# Altium schematic sheet Controller_Section.SchDoc
size 420 x 297 mm; DocumentNumber: 7; SheetNumber: 7; SheetTotal: 17
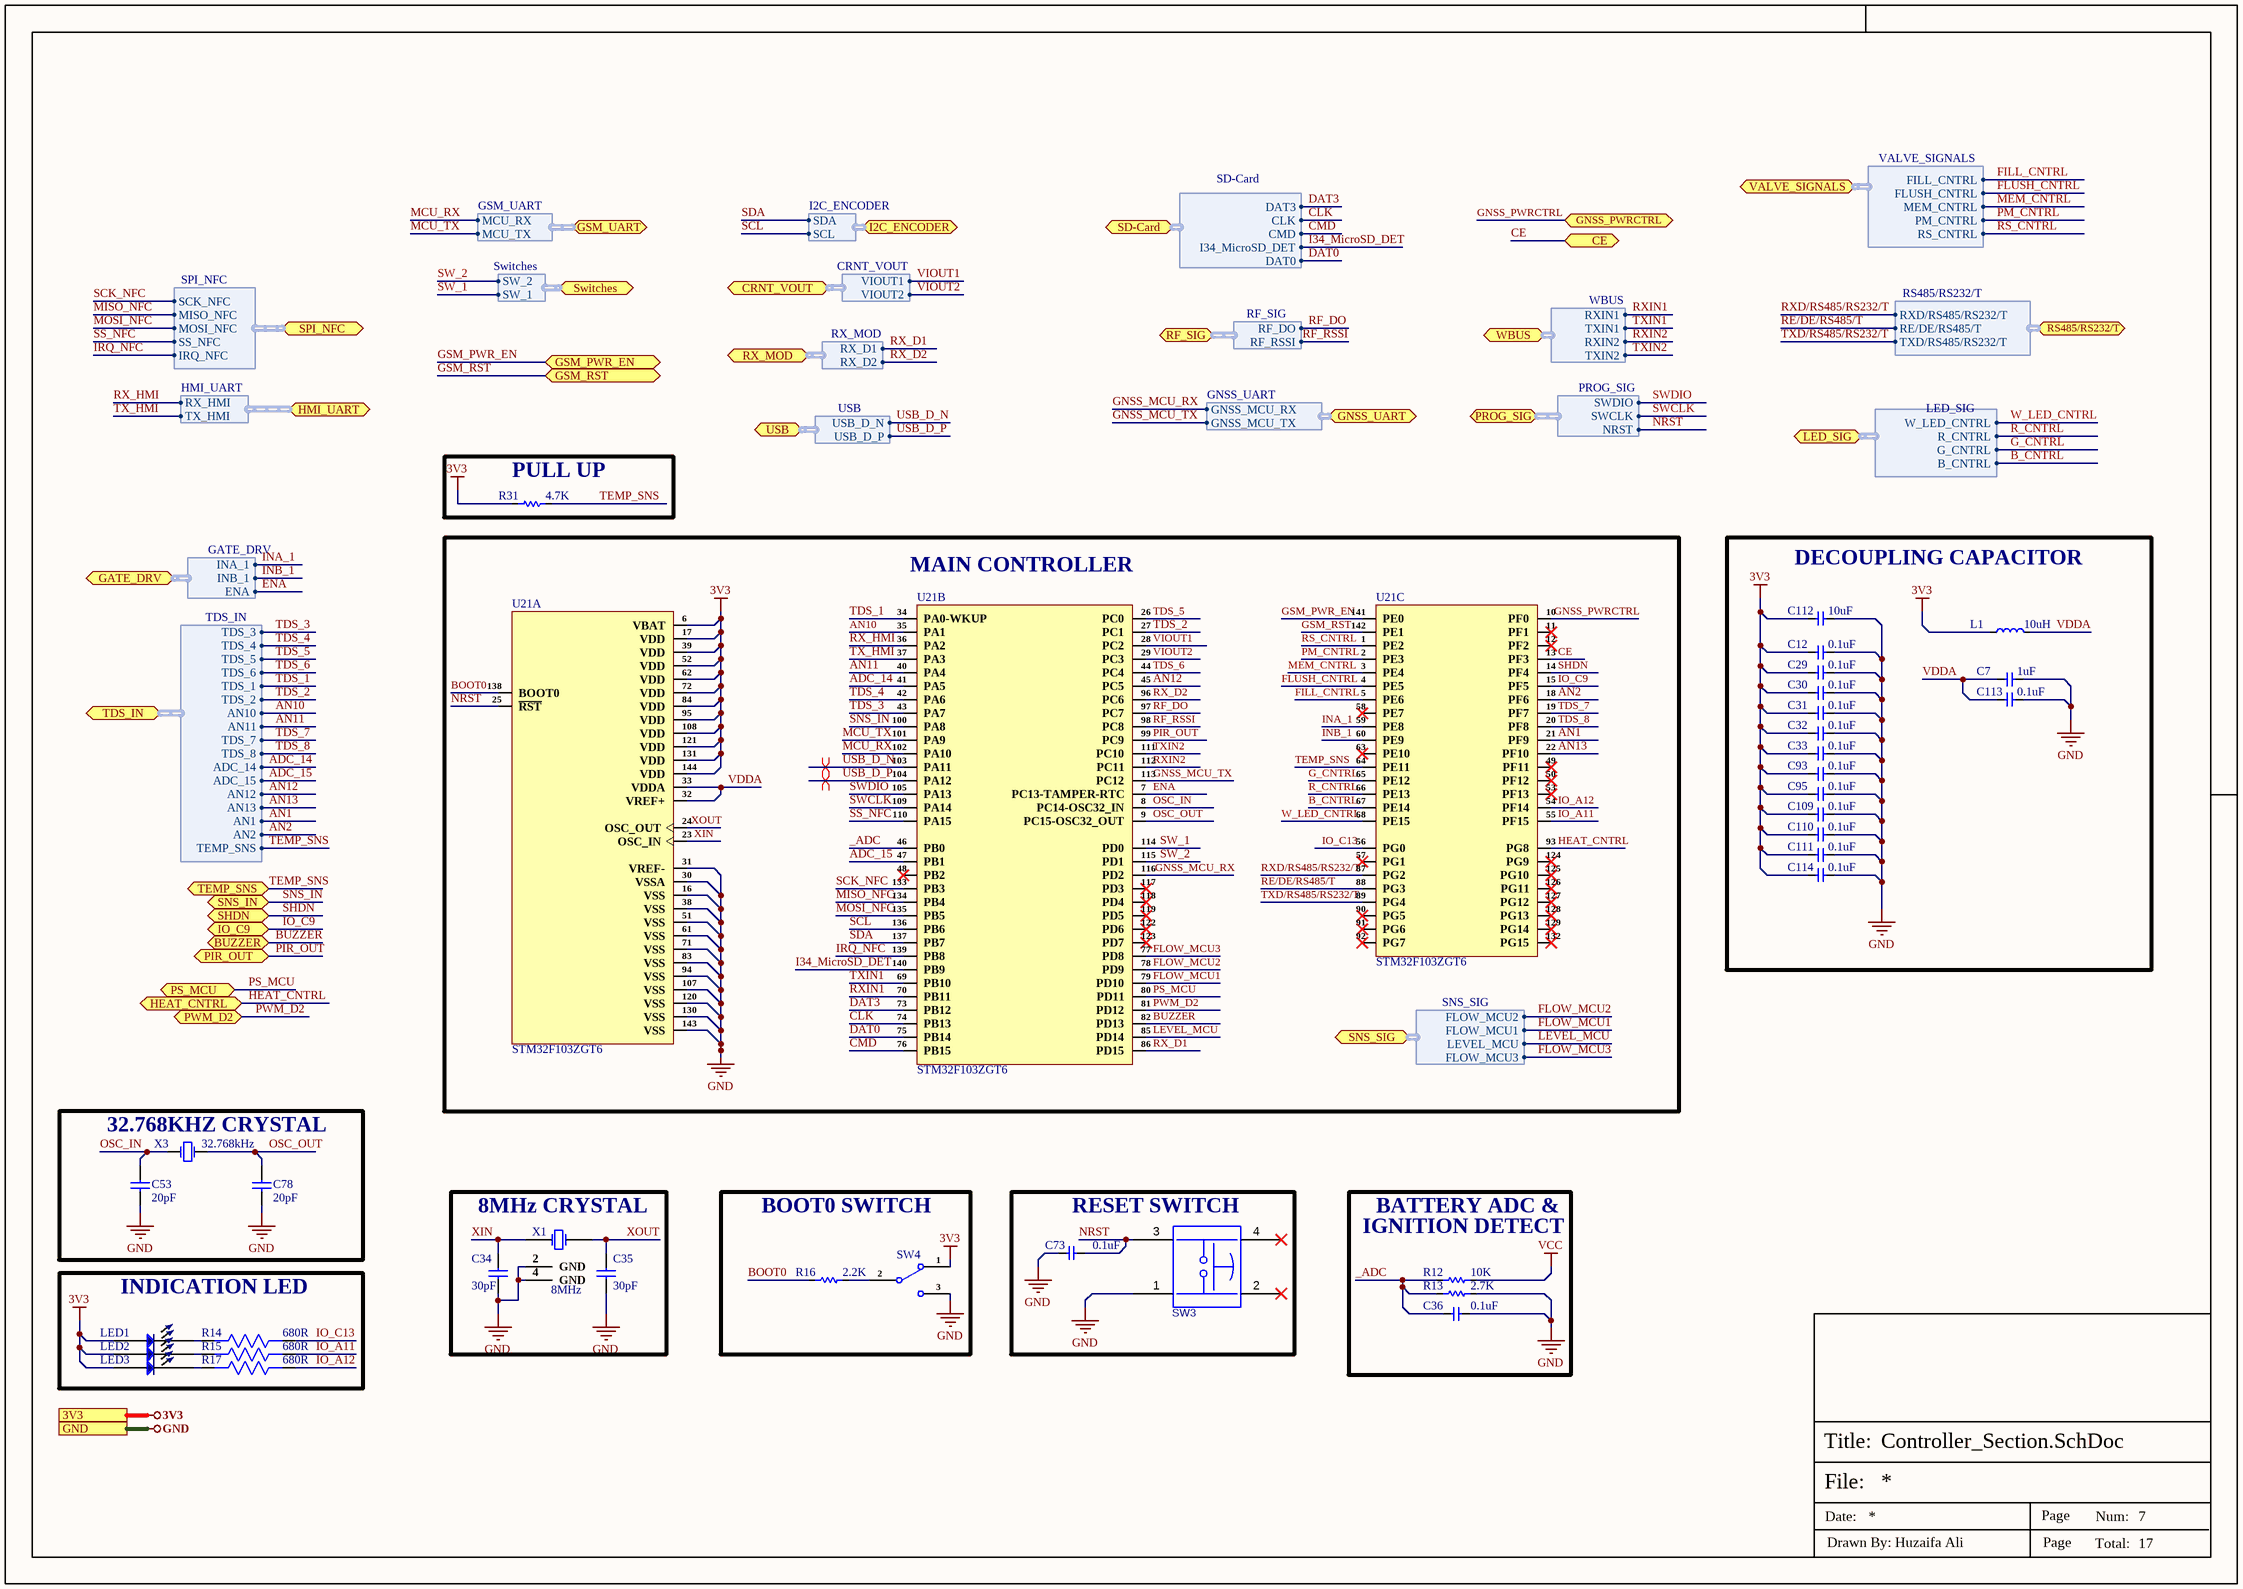
[diagram p0: Controller_Section.SchDoc]

## Parts
C7  1uF  [Cap-0402]
C12  0.1uF  [Cap-0402]
C29  0.1uF  [Cap-0402]
C30  0.1uF  [Cap-0402]
C31  0.1uF  [Cap-0402]
C32  0.1uF  [Cap-0402]
C33  0.1uF  [Cap-0402]
C34  30pF  [Cap0603]
C35  30pF  [Cap0603]
C36  0.1uF  [Cap-0402]
C53  20pF  [Cap0603]
C73  0.1uF  [Cap-0402]
C78  20pF  [Cap0603]
C93  0.1uF  [Cap-0402]
C95  0.1uF  [Cap-0402]
C109  0.1uF  [Cap-0402]
C110  0.1uF  [Cap-0402]
C111  0.1uF  [Cap-0402]
C112  10uF  [Cap-0402]
C113  0.1uF  [Cap-0402]
C114  0.1uF  [Cap-0402]
L1  10uH  [Ind-0805]
LED1  XZMDK68W-2  [LED 0402]  (value not drawn)
LED2  XZMDK68W-2  [LED 0402]  (value not drawn)
LED3  XZMDK68W-2  [LED 0402]  (value not drawn)
R12  10K  [Res-0402]
R13  2.7K  [Res-0402]
R14  680R  [RES-0603]
R15  680R  [RES-0603]
R16  2.2K  [Res-0402]
R17  680R  [RES-0603]
R31  4.7K  [Res-0402]
SW3  (no value)  [TL3300CF160Q]
SW4  (no value)  [SS-12D02-G040]
U21  STM32F103ZGT6  [LQFP-144(20x20)]  (parts A,B,C of 3)
X1  8MHz  [XC32M4-8.000-F18LJDT]
X3  32.768kHz  [X321532768KGD2SI]

## Blocks framed on the sheet
PULL UP: R31
MAIN CONTROLLER: U21
DECOUPLING CAPACITOR: C7 C12 C29-C33 C93 C95 C109-C114 L1
32.768KHZ CRYSTAL: C53 C78 X3
8MHz CRYSTAL: C34 C35 X1
BOOT0 SWITCH: R16 SW4
RESET SWITCH: C73 SW3
INDICATION LED: LED1-LED3 R14 R15 R17

## Ports
3V3, BUZZER (bidir), CE (bidir), CRNT_VOUT (bidir, harness CRNT_VOUT), GATE_DRV (bidir, harness GATE_DRV), GND, GNSS_PWRCTRL (bidir), GNSS_UART (bidir, harness GNSS_UART), GSM_PWR_EN (bidir), GSM_RST (bidir), GSM_UART (bidir, harness GSM_UART), HEAT_CNTRL (bidir), HMI_UART (bidir, harness HMI_UART), I2C_ENCODER (bidir, harness I2C_ENCODER), IO_C9 (bidir), LED_SIG (bidir, harness LED_SIG), PIR_OUT (bidir), PROG_SIG (bidir, harness PROG_SIG), PS_MCU (bidir), PWM_D2 (bidir), RF_SIG (bidir, harness RF_SIG), RS485/RS232/T (bidir, harness RS485/RS232/T), RX_MOD (bidir, harness RX_MOD), SD-Card (bidir, harness SD-Card), SHDN (bidir), SNS_IN (bidir), SNS_SIG (bidir, harness SNS_SIG), SPI_NFC (bidir, harness SPI_NFC), Switches (bidir, harness Switches), TDS_IN (bidir, harness TDS_IN), TEMP_SNS (bidir), USB (bidir, harness USB), VALVE_SIGNALS (bidir, harness VALVE_SIGNALS), WBUS (bidir, harness WBUS)

## Harnesses
PROG_SIG: SWDIO, SWCLK, NRST
GATE_DRV: INA_1, INB_1, ENA
LED_SIG: R_CNTRL, G_CNTRL, B_CNTRL, W_LED_CNTRL
VALVE_SIGNALS: FILL_CNTRL, FLUSH_CNTRL, MEM_CNTRL, PM_CNTRL, RS_CNTRL
SNS_SIG: FLOW_MCU1, LEVEL_MCU, FLOW_MCU2, FLOW_MCU3
WBUS: RXIN1, TXIN1, RXIN2, TXIN2
RF_SIG: RF_DO, RF_RSSI
RX_MOD: RX_D1, RX_D2
CRNT_VOUT: VIOUT1, VIOUT2
TDS_IN: TDS_1, TDS_2, AN10, AN11, TDS_3, TDS_4, TDS_5, TDS_6, TDS_7, TDS_8, ADC_14, ADC_15, AN12, AN13, AN1, AN2, TEMP_SNS
USB: USB_D_N, USB_D_P
Switches: SW_1, SW_2
GSM_UART: MCU_RX, MCU_TX
GNSS_UART: GNSS_MCU_RX, GNSS_MCU_TX
SD-Card: DAT3, CLK, CMD, DAT0, I34_MicroSD_DET
HMI_UART: RX_HMI, TX_HMI
I2C_ENCODER: SDA, SCL
SPI_NFC: MISO_NFC, MOSI_NFC, SS_NFC, IRQ_NFC, SCK_NFC
RS485/RS232/T: RXD/RS485/RS232/T, RE/DE/RS485/T, TXD/RS485/RS232/T

## Nets
3V3: C12.1 C29.1 C30.1 C31.1 C32.1 C33.1 C93.1 C95.1 C109.1 C110.1 C111.1 C112.1 C114.1 L1.1 LED1.1 LED2.1 LED3.1 R31.1 SW4.1 U21.6(VBAT) U21.17(VDD) U21.39(VDD) U21.52(VDD) U21.62(VDD) U21.72(VDD) U21.84(VDD) U21.95(VDD) U21.108(VDD) U21.121(VDD) U21.131(VDD) U21.144(VDD) ; port 3V3
GND: C7.2 C12.2 C29.2 C30.2 C31.2 C32.2 C33.2 C34.1 C35.1 C36.2 C53.1 C73.1 C78.1 C93.2 C95.2 C109.2 C110.2 C111.2 C112.2 C113.2 C114.2 R13.2 SW3.1 SW4.3 U21.16(VSS) U21.30(VSSA) U21.31(VREF-) U21.38(VSS) U21.51(VSS) U21.61(VSS) U21.71(VSS) U21.83(VSS) U21.94(VSS) U21.107(VSS) U21.120(VSS) U21.130(VSS) U21.143(VSS) X1.2(GND) X1.4(GND) ; port GND
VCC: R12.2
_ADC: C36.1 R12.1 R13.1 U21.46(PB0)
ADC_14: U21.41(PA5) ; port TDS_IN.ADC_14
ADC_15: U21.47(PB1) ; port TDS_IN.ADC_15
AN1: U21.21(PF9) ; port TDS_IN.AN1
AN2: U21.18(PF6) ; port TDS_IN.AN2
AN10: U21.35(PA1) ; port TDS_IN.AN10
AN11: U21.40(PA4) ; port TDS_IN.AN11
AN12: U21.45(PC5) ; port TDS_IN.AN12
AN13: U21.22(PF10) ; port TDS_IN.AN13
B_CNTRL: U21.67(PE14) ; port LED_SIG.B_CNTRL
BOOT0: R16.1 U21.138(BOOT0)
BUZZER: U21.82(PD13) ; port BUZZER
CE: U21.13(PF3) ; port CE
CLK: U21.74(PB13) ; port SD-Card.CLK
CMD: U21.76(PB15) ; port SD-Card.CMD
DAT0: U21.75(PB14) ; port SD-Card.DAT0
DAT3: U21.73(PB12) ; port SD-Card.DAT3
ENA: U21.7(PC13-TAMPER-RTC) ; port GATE_DRV.ENA
FILL_CNTRL: U21.5(PE6) ; port VALVE_SIGNALS.FILL_CNTRL
FLOW_MCU1: U21.79(PD10) ; port SNS_SIG.FLOW_MCU1
FLOW_MCU2: U21.78(PD9) ; port SNS_SIG.FLOW_MCU2
FLOW_MCU3: U21.77(PD8) ; port SNS_SIG.FLOW_MCU3
FLUSH_CNTRL: U21.4(PE5) ; port VALVE_SIGNALS.FLUSH_CNTRL
G_CNTRL: U21.65(PE12) ; port LED_SIG.G_CNTRL
GNSS_MCU_RX: U21.116(PD2) ; port GNSS_UART.GNSS_MCU_RX
GNSS_MCU_TX: U21.113(PC12) ; port GNSS_UART.GNSS_MCU_TX
GNSS_PWRCTRL: U21.10(PF0) ; port GNSS_PWRCTRL
GSM_PWR_EN: U21.141(PE0) ; port GSM_PWR_EN
GSM_RST: U21.142(PE1) ; port GSM_RST
HEAT_CNTRL: U21.93(PG8) ; port HEAT_CNTRL
I34_MicroSD_DET: U21.140(PB9) ; port SD-Card.I34_MicroSD_DET
INA_1: U21.59(PE8) ; port GATE_DRV.INA_1
INB_1: U21.60(PE9) ; port GATE_DRV.INB_1
IO_A11: R15.1 U21.55(PF15)
IO_A12: R17.1 U21.54(PF14)
IO_C9: U21.15(PF5) ; port IO_C9
IO_C13: R14.1 U21.56(PG0)
IRQ_NFC: U21.139(PB8) ; port SPI_NFC.IRQ_NFC
LEVEL_MCU: U21.85(PD14) ; port SNS_SIG.LEVEL_MCU
MCU_RX: U21.102(PA10) ; port GSM_UART.MCU_RX
MCU_TX: U21.101(PA9) ; port GSM_UART.MCU_TX
MEM_CNTRL: U21.3(PE4) ; port VALVE_SIGNALS.MEM_CNTRL
MISO_NFC: U21.134(PB4) ; port SPI_NFC.MISO_NFC
MOSI_NFC: U21.135(PB5) ; port SPI_NFC.MOSI_NFC
NRST: C73.2 SW3.3 U21.25(~{RST}) ; port PROG_SIG.NRST
OSC_IN: C53.2 U21.8(PC14-OSC32_IN) X3.1(OSC1)
OSC_OUT: C78.2 U21.9(PC15-OSC32_OUT) X3.2(OSC2)
PIR_OUT: U21.99(PC9) ; port PIR_OUT
PM_CNTRL: U21.2(PE3) ; port VALVE_SIGNALS.PM_CNTRL
PS_MCU: U21.80(PD11) ; port PS_MCU
PWM_D2: U21.81(PD12) ; port PWM_D2
R_CNTRL: U21.66(PE13) ; port LED_SIG.R_CNTRL
RE/DE/RS485/T: U21.88(PG3) ; port RS485/RS232/T.RE/DE/RS485/T
RF_DO: U21.97(PC7) ; port RF_SIG.RF_DO
RF_RSSI: U21.98(PC8) ; port RF_SIG.RF_RSSI
RS_CNTRL: U21.1(PE2) ; port VALVE_SIGNALS.RS_CNTRL
RX_D1: U21.86(PD15) ; port RX_MOD.RX_D1
RX_D2: U21.96(PC6) ; port RX_MOD.RX_D2
RX_HMI: U21.36(PA2) ; port HMI_UART.RX_HMI
RXD/RS485/RS232/T: U21.87(PG2) ; port RS485/RS232/T.RXD/RS485/RS232/T
RXIN1: U21.70(PB11) ; port WBUS.RXIN1
RXIN2: U21.112(PC11) ; port WBUS.RXIN2
SCK_NFC: U21.133(PB3) ; port SPI_NFC.SCK_NFC
SCL: U21.136(PB6) ; port I2C_ENCODER.SCL
SDA: U21.137(PB7) ; port I2C_ENCODER.SDA
SHDN: U21.14(PF4) ; port SHDN
SNS_IN: U21.100(PA8) ; port SNS_IN
SS_NFC: U21.110(PA15) ; port SPI_NFC.SS_NFC
SW_1: U21.114(PD0) ; port Switches.SW_1
SW_2: U21.115(PD1) ; port Switches.SW_2
SWCLK: U21.109(PA14) ; port PROG_SIG.SWCLK
SWDIO: U21.105(PA13) ; port PROG_SIG.SWDIO
TDS_1: U21.34(PA0-WKUP) ; port TDS_IN.TDS_1
TDS_2: U21.27(PC1) ; port TDS_IN.TDS_2
TDS_3: U21.43(PA7) ; port TDS_IN.TDS_3
TDS_4: U21.42(PA6) ; port TDS_IN.TDS_4
TDS_5: U21.26(PC0) ; port TDS_IN.TDS_5
TDS_6: U21.44(PC4) ; port TDS_IN.TDS_6
TDS_7: U21.19(PF7) ; port TDS_IN.TDS_7
TDS_8: U21.20(PF8) ; port TDS_IN.TDS_8
TEMP_SNS: R31.2 U21.64(PE11) ; port TEMP_SNS, port TDS_IN.TEMP_SNS
TX_HMI: U21.37(PA3) ; port HMI_UART.TX_HMI
TXD/RS485/RS232/T: U21.89(PG4) ; port RS485/RS232/T.TXD/RS485/RS232/T
TXIN1: U21.69(PB10) ; port WBUS.TXIN1
TXIN2: U21.111(PC10) ; port WBUS.TXIN2
USB_D_N: U21.103(PA11) ; port USB.USB_D_N
USB_D_P: U21.104(PA12) ; port USB.USB_D_P
VDDA: C7.1 C113.1 L1.2 U21.32(VREF+) U21.33(VDDA)
VIOUT1: U21.28(PC2) ; port CRNT_VOUT.VIOUT1
VIOUT2: U21.29(PC3) ; port CRNT_VOUT.VIOUT2
W_LED_CNTRL: U21.68(PE15) ; port LED_SIG.W_LED_CNTRL
XIN: C34.2 U21.23(OSC_IN) X1.1(CRYSTAL)
XOUT: C35.2 U21.24(OSC_OUT) X1.3(CRYSTAL)
NetLED1_2: LED1.2 R14.2
NetLED2_2: LED2.2 R15.2
NetLED3_2: LED3.2 R17.2
NetR16_2: R16.2 SW4.2

Not connected (* = marked no-connect by the designer): SW3 2* 4*; U21 11(PF1)* 12(PF2)* 48(PB2)* 49(PF11)* 50(PF12)* 53(PF13)* 57(PG1)* 58(PE7)* 63(PE10)* 90(PG5)* 91(PG6)* 92(PG7)* 117(PD3)* 118(PD4)* 119(PD5)* 122(PD6)* 123(PD7)* 124(PG9)* 125(PG10)* 126(PG11)* 127(PG12)* 128(PG13)* 129(PG14)* 132(PG15)*

## Layout directives
differential pair; differential pair class USB_D_Lines; net class USB_D; rule Matched Net Lengths [Tolerance = 50mil]; rule Impedance Constraint [Min = 85.00    Max = 90.00    ]: USB_D_N, USB_D_P

## Notes on the sheet
- IGNITION DETECT
- BATTERY ADC &
- File:
- Title:
- Date:
- Page
- Num:
- Total:
- Drawn By: Huzaifa Ali

## Library data of the parts
C7 = CC0402KRX5R7BB105: CAP CER 1UF 16V X5R 0402; Manufacturer: Yageo; Tolerance: 10%; Item Type: Capacitor; Supplier 1: Digi-Key; Manufacturer Part Number: CC0402KRX5R7BB105; Stock 1: 1405667; Pricing 1: 1=0.36, 10=0.252, 100=0.1512, 500=0.1134, 1000=0.09576, 2500=0.09072, 5000=0.08568 (USD); Mount: Surface Mount; Case/Package: 0402; Case Code (Metric): 1005; Case Code (Imperial): 0402; Weight: 2.3E-05oz; Min Operating Temperature: -55°C; Max Operating Temperature: 85°C; Capacitance: 1uF; Packaging: Tape and Reel; Voltage Rating: 16V; Dielectric: X5R; Termination: SMD/SMT; Voltage Rating (DC): 16V; Length: 1mm; Width: 0.02inch; Height: 0.5mm; Thickness: 0.022inch; ComponentLink1URL: http://www.yageo.com/documents/recent/UPY-GPHC_X5R_4V-to-50V_12.pdf?src-supplier=Avnet+Europe; ComponentLink1Description: http://www.yageo.com/documents/recent/UPY-GPHC_X5R_4V-to-50V_12.pdf?src-supplier=Avnet+Europe; Supplier Part Number 1: 311-1691-6-ND; Composition: Ceramic; Depth: 0.5mm; Radiation Hardening: No; Lead Free: Lead Free; Halogen Free: Halogen Free; LCSC Part Number: C325464
C12 C29-C33 C36 C73 C93 C95 C109-C111 C113 C114 = C1005X5R1H104K050BB: CAP CER 0.1UF 50V X5R 0402; Manufacturer: TDK; Capacitance: 100nF; Tolerance: 10%; Dielectric Material: Ceramic; Item Type: Capacitor; Supplier 1: Digi-Key; Manufacturer Part Number: C1005X5R1H104K050BB; Stock 1: 1455182; Pricing 1: 1=0.12, 10=0.09, 50=0.049, 100=0.04, 500=0.02858, 1000=0.02245, 2500=0.02041, 5000=0.01878 (USD); Mount: Surface Mount; Case/Package: 0402; Case Code (Metric): 1005; Case Code (Imperial): 0402; Weight: 2.3E-05oz; Min Operating Temperature: -55°C; Max Operating Temperature: 85°C; Packaging: Tape and Reel; Voltage Rating: 50V; Dielectric: X5R; Termination: SMD/SMT; Voltage Rating (DC): 50V; Package Quantity: 1; Length: 1mm; Width: 0.02inch; Height: 0.5mm; Thickness: 0.022inch; RoHS Compliant: Yes; ComponentLink1URL: https://product.tdk.com/info/en/catalog/spec/mlccspec_commercial_general_midvoltage_en.pdf?src-supplier=Digi-Key; ComponentLink1Description: https://product.tdk.com/info/en/catalog/spec/mlccspec_commercial_general_midvoltage_en.pdf?src-supplier=Digi-Key; ComponentLink2URL: http://www.tdk.co.jp/tefe02/e413_c.pdf?src-supplier=Future+Electronics; ComponentLink2Description: http://www.tdk.co.jp/tefe02/e413_c.pdf?src-supplier=Future+Electronics; ComponentLink3URL: https://www.verical.com/server-webapp/html/getDatasheet?partID=743571&src-supplier=Verical; ComponentLink3Description: https://www.verical.com/server-webapp/html/getDatasheet?partID=743571&src-supplier=Verical; Supplier Part Number 1: 445-5942-1-ND; Construction: Flat; Resistor Type: Ceramic; Voltage: 50V; Series: C; Depth: 0.5mm; Radiation Hardening: No; Lead Free: Lead Free; REACH SVHC: No SVHC; ComponentLink4URL: http://www.tdk.co.jp/tefe02/e412_c.pdf?src-supplier=Avnet+Europe; ComponentLink4Description: http://www.tdk.co.jp/tefe02/e412_c.pdf?src-supplier=Avnet+Europe; LCSC Part Number: C2181865
C34 C35 = CC0603JRNPO9BN300: CAP 30pF NP0 0603 50 V ±5 % SMD; Manufacturer: Yageo; Tolerance: 5%; Dielectric: C0G; Voltage Rating: 50V; Dissipation Factor: 0.1%; Insulation Resistance: 10GR; Supplier 1: Digi-Key; Manufacturer Part Number: CC0603JRNPO9BN300; RoHS: Yes; Category: Ceramic Capacitors; Stock 1: 36700; Pricing 1: 1=0.10000, 10=0.06800, 50=0.03700, 100=0.03020, 500=0.02160, 1000=0.01697 (USD); Mount: Surface Mount; Case/Package: 0603; Number of Pins: 2; Case Code (Imperial): 0603; Case Code (Metric): 1608; Weight: 7.1E-05oz; Min Operating Temperature: -55°C; Max Operating Temperature: 125°C; Capacitance: 30pF; Packaging: Tape and Reel; Voltage Rating (DC): 50V; Termination: SMD/SMT; Resistor Type: Ceramic; Series: CC; Construction: Flat; Length: 1.6mm; Width: 0.031inch; Height: 0.8mm; Thickness: 0.035inch; Depth: 0.8mm; Radiation Hardening: No; REACH SVHC: No SVHC; Lead Free: Lead Free; RoHS Compliant: Yes; ComponentLink1URL: https://datasheet.ciiva.com/26862/getdatasheetpartid-403531-26862766.pdf?src-supplier=Verical; ComponentLink1Description: https://datasheet.ciiva.com/26862/getdatasheetpartid-403531-26862766.pdf?src-supplier=Verical; ComponentLink2URL: https://datasheet.ciiva.com/13264/upy-gp-np0-16v-to-50v-8-3714-13264406.pdf?src-supplier=Mouser; ComponentLink2Description: https://datasheet.ciiva.com/13264/upy-gp-np0-16v-to-50v-8-3714-13264406.pdf?src-supplier=Mouser; ComponentLink3URL: https://datasheet.ciiva.com/7978/1132289-7978140.pdf?src-supplier=Element14; ComponentLink3Description: https://datasheet.ciiva.com/7978/1132289-7978140.pdf?src-supplier=Element14; ComponentLink4URL: https://datasheet.ciiva.com/28450/1443161-28450494.pdf?src-supplier=Element14; ComponentLink4Description: https://datasheet.ciiva.com/28450/1443161-28450494.pdf?src-supplier=Element14; Supplier Part Number 1: 311-3357-1-ND
C53 C78 = CC0603JRNPO9BN200: CAP CER 20PF 50V C0G/NPO 0603; Manufacturer: Yageo; Tolerance: 5%; Dielectric: C0G; Supplier 1: Digi-Key; Manufacturer Part Number: CC0603JRNPO9BN200; Stock 1: 180060; Pricing 1: 1=0.1, 10=0.046, 100=0.0205, 500=0.01466, 1000=0.01152 (USD); Mount: Surface Mount; Case/Package: 0603; Number of Pins: 2; Weight: 7.1E-05oz; Case Code (Imperial): 0603; Case Code (Metric): 1608; Min Operating Temperature: -55°C; Max Operating Temperature: 125°C; Capacitance: 20pF; Package Quantity: 4000; Voltage Rating (DC): 50V; Packaging: Tape and Reel; Voltage Rating: 50V; Termination: SMD/SMT; Composition: Ceramic; Length: 1.6mm; Width: 0.8mm; Thickness: 0.035inch; Depth: 0.8mm; REACH SVHC: Unknown; Lead Free: Lead Free; ComponentLink1URL: http://www.farnell.com/datasheets/1132289.pdf?src-supplier=Element14; ComponentLink1Description: http://www.farnell.com/datasheets/1132289.pdf?src-supplier=Element14; ComponentLink2URL: http://www.yageo.com/documents/recent/UPY-GP_NP0_16V-to-50V_16.pdf?src-supplier=Digi-Key; ComponentLink2Description: http://www.yageo.com/documents/recent/UPY-GP_NP0_16V-to-50V_16.pdf?src-supplier=Digi-Key; Supplier Part Number 1: 311-1424-1-ND
C112 = CC0402MRX5R6BB106: CAP CER 10UF 10V X5R 0402; Manufacturer: Yageo; Tolerance: 20%; Item Type: Capacitor; Supplier 1: Future Electronics; Manufacturer Part Number: CC0402MRX5R6BB106; RoHS: Yes; Category: Ceramic Capacitors; Stock 1: 80000; Pricing 1: 10000=0.02650, 20000=0.02590, 30000=0.02550, 40000=0.02530, 50000=0.02450 (USD); Mount: Surface Mount; Case/Package: 0402; Case Code (Imperial): 0402; Case Code (Metric): 1005; Min Operating Temperature: -55°C; Max Operating Temperature: 85°C; Packaging: Tape and Reel; Capacitance: 10uF; Voltage Rating: 10V; RoHS Compliant: Yes; ComponentLink1URL: http://www.yageo.com/documents/recent/UPY-GPHC_X5R_4V-to-50V_25.pdf?src-supplier=Digi-Key; ComponentLink1Description: http://www.yageo.com/documents/recent/UPY-GPHC_X5R_4V-to-50V_25.pdf?src-supplier=Digi-Key; Supplier Part Number 1: 6097631; LCSC Part Number: C962143
L1 = MGFL2012F100MT-LF: IND SMD 10uH 500mA 0805; Manufacturer: microgate; Tolerance: ±20%; DC Resistance (DCR): 320mΩ; Item Type: Inductor; Inductance: 10uH; Rated Current: 500mA; Manufacturer Part Number: MGFL2012F100MT-LF; LCSC Part Number: C281113
LED1-LED3 = XZMDK68W-2: LED RED CLEAR CHIP SMD; Manufacturer: SunLED; Lens Color: Colorless; Luminous Intensity: 69mcd; Test Current: 20mA; Viewing Angle: 120°; Dominant Wavelength: 630nm; Forward Voltage: 1.95V; Supplier 1: Digi-Key; Manufacturer Part Number: XZMDK68W-2; Stock 1: 69539; Pricing 1: 1=0.43, 10=0.306, 100=0.136, 500=0.0952, 1000=0.0782 (USD); Mount: Surface Mount; Case/Package: 0402; Color: Red; Case Code (Metric): 1005; Case Code (Imperial): 0402; Packaging: Tape and Reel; Lens Transparency: Clear; Length: 1mm; Height: 0.6mm; Width: 0.5mm; ComponentLink1URL: http://www.sunledusa.com/products/spec/XZMDK68W-2.pdf?src-supplier=Digi-Key; ComponentLink1Description: http://www.sunledusa.com/products/spec/XZMDK68W-2.pdf?src-supplier=Digi-Key; ComponentLink2URL: https://www.sunledusa.com/products/spec/XZMDK68W-2.pdf?src-supplier=Digi-Key; ComponentLink2Description: https://www.sunledusa.com/products/spec/XZMDK68W-2.pdf?src-supplier=Digi-Key; Supplier Part Number 1: 1497-1174-6-ND
R12 = RC0402FR-0710KL: RES 10K OHM 1% 1/16W 0402; Manufacturer: Yageo; Item Type: Resistor; Resistance: 10kR; Voltage Rating (DC): 50V; Temperature Coefficient: 100ppm/°C; Power Rating: 62.5mW; Max Power Dissipation: 63mW; Manufacturer Part Number: RC0402FR-0710KL; LCSC Part Number: C60490; ComponentLink7Description: https://datasheet.ciiva.com/7849/1784430-7849815.pdf?src-supplier=Element14; ComponentLink7URL: https://datasheet.ciiva.com/7849/1784430-7849815.pdf?src-supplier=Element14; Supplier 1: Mouser; RoHS: Yes; Category: Chip SMD Resistors; Stock 1: 18648329; Pricing 1: 1=0.10000, 10=0.01400, 50=0.01400, 100=0.00500, 1000=0.00300, 10000=0.00200 (USD); Case/Package: 0402; Number of Pins: 2; Case Code (Imperial): 0402; Case Code (Metric): 1005; Min Operating Temperature: -55°C; Max Operating Temperature: 155°C; Resistor Type: Thick Film; Tolerance: 1%; Packaging: Tape and Reel; Voltage Rating: 50V; Termination: SMD/SMT; Working Voltage: 50V; Number of Terminations: 2; Features: Moisture Resistant; Series: RC; Resistance Tolerance: 1%; Construction: Rectangular; Length: 1mm; Width: 0.5mm; Height: 0.32mm; Depth: 0.5mm; Lead Pitch: 0.2mm; REACH SVHC: No SVHC; Lead Free: Lead Free; RoHS Compliant: Yes; Military Standard: Not; ComponentLink1URL: https://datasheet.ciiva.com/7660/38568-7660787.pdf?src-supplier=Element14; ComponentLink1Description: https://datasheet.ciiva.com/7660/38568-7660787.pdf?src-supplier=Element14; ComponentLink2URL: https://datasheet.ciiva.com/7849/1686128-7849814.pdf?src-supplier=Element14; ComponentLink2Description: https://datasheet.ciiva.com/7849/1686128-7849814.pdf?src-supplier=Element14; ComponentLink3URL: https://datasheet.ciiva.com/7983/1018594-7983486.pdf?src-supplier=Element14; ComponentLink3Description: https://datasheet.ciiva.com/7983/1018594-7983486.pdf?src-supplier=Element14; ComponentLink4URL: https://datasheet.ciiva.com/22747/1018594-22747512.pdf?src-supplier=Element14; ComponentLink4Description: https://datasheet.ciiva.com/22747/1018594-22747512.pdf?src-supplier=Element14; ComponentLink5URL: https://datasheet.ciiva.com/12667/pyu-rc0402-51-rohs-l-6-r-12667067.pdf?src-supplier=Mouser; ComponentLink5Description: https://datasheet.ciiva.com/12667/pyu-rc0402-51-rohs-l-6-r-12667067.pdf?src-supplier=Mouser; ComponentLink6URL: https://datasheet.ciiva.com/7849/1784430-7849813.pdf?src-supplier=Element14; ComponentLink6Description: https://datasheet.ciiva.com/7849/1784430-7849813.pdf?src-supplier=Element14; Supplier Part Number 1: 603-RC0402FR-0710KL
R13 = RC0402FR-072K7L: RES 2.7K OHM 1% 1/16W 0402; Temperature Coefficient: 100ppm/°C; Power Rating: 62.5mW; Voltage Rating: 50V; Max Power Dissipation: 63mW; Item Type: Resistor; Value: 2.7kR; RoHS: Yes; Category: Chip SMD Resistors; Case/Package: 0402; Case Code (Imperial): 0402; Case Code (Metric): 1005; Min Operating Temperature: -55°C; Max Operating Temperature: 155°C; Tolerance: 1%; Packaging: Tape and Reel; Resistor Type: Thick Film; Package Quantity: 1; Termination: SMD/SMT; Number of Terminations: 2; Features: Moisture Resistant; Series: RC; Resistance Tolerance: 1%; Construction: Rectangular; Length: 0.039inch; Width: 0.02inch; Height: 0.016inch; Depth: 0.5mm; Reach SVHC Compliant: Unknown; Lead Free: Lead Free; Military Standard: Not; RoHS Compliant: Yes; LCSC Part Number: C138017; ComponentLink1Description: LCSC; Supplier: Future Electronics; Supplier Part Number: 3672441; Stock: 490000; Pricing: 10000=0.0009, 50000=0.0008, 300000=0.0008, 1000000=0.0007, 3000000=0.0007 (USD); Voltage Rating (AC): 50V; ComponentLink2URL: https://datasheet.ciiva.com/2519/pyu-r-int-thick-7-2519163.pdf?src-supplier=Digi-Key; ComponentLink2Description: https://datasheet.ciiva.com/2519/pyu-r-int-thick-7-2519163.pdf?src-supplier=Digi-Key; ComponentLink3URL: https://datasheet.ciiva.com/2519/pyu-r-int-thick-7-2519164.pdf?src-supplier=Digi-Key; ComponentLink3Description: https://datasheet.ciiva.com/2519/pyu-r-int-thick-7-2519164.pdf?src-supplier=Digi-Key; ComponentLink4URL: https://datasheet.ciiva.com/2519/pyu-r-int-thick-7-2519162.pdf?src-supplier=Digi-Key; ComponentLink4Description: https://datasheet.ciiva.com/2519/pyu-r-int-thick-7-2519162.pdf?src-supplier=Digi-Key; ComponentLink5URL: https://datasheet.ciiva.com/12656/pyu-rc0402-51-rohs-l-6-r-12656777.pdf?src-supplier=Mouser; ComponentLink5Description: https://datasheet.ciiva.com/12656/pyu-rc0402-51-rohs-l-6-r-12656777.pdf?src-supplier=Mouser; ComponentLink6URL: https://datasheet.ciiva.com/7849/1018594-7849932.pdf?src-supplier=Element14; ComponentLink6Description: https://datasheet.ciiva.com/7849/1018594-7849932.pdf?src-supplier=Element14; ComponentLink7URL: https://datasheet.ciiva.com/7849/1018594-7849933.pdf?src-supplier=Element14; ComponentLink7Description: https://datasheet.ciiva.com/7849/1018594-7849933.pdf?src-supplier=Element14
R14 R15 R17 = RC0603FR-07680RL: RES SMD 680 OHM 1% 1/10W 0603; Manufacturer: Yageo; Temperature Coefficient: 100ppm/°C; Voltage Rating (DC): 50V; Power Rating: 100mW; Supplier 1: Digi-Key; Manufacturer Part Number: RC0603FR-07680RL; Stock 1: 4278227; Pricing 1: 1=0.1, 10=0.024, 100=0.0097, 1000=0.00437, 2500=0.00379 (USD); Case/Package: 0603; Number of Pins: 2; Case Code (Imperial): 0603; Case Code (Metric): 1608; Min Operating Temperature: -55°C; Max Operating Temperature: 155°C; Resistance: 680R; Tolerance: 1%; Composition: Thick Film; Packaging: Tape and Reel; Number of Terminations: 2; Military Standard: Not; Voltage Rating: 50V; Package Quantity: 1; Termination: SMD/SMT; Max Power Dissipation: 100mW; Features: Moisture Resistant; Length: 1.6mm; Height: 0.022inch; Width: 0.031inch; Depth: 0.8mm; REACH SVHC: No SVHC; Lead Free: Lead Free; ComponentLink1URL: http://www.farnell.com/datasheets/1868787.pdf?src-supplier=Element14; ComponentLink1Description: http://www.farnell.com/datasheets/1868787.pdf?src-supplier=Element14; ComponentLink2URL: http://documents.rs-components.com/techlib://itc_doclist_GB.htm?stockno=5048221&src-supplier=RSComponents; ComponentLink2Description: http://documents.rs-components.com/techlib://itc_doclist_GB.htm?stockno=5048221&src-supplier=RSComponents; ComponentLink3URL: http://www.farnell.com/datasheets/443971.pdf?src-supplier=Element14; ComponentLink3Description: http://www.farnell.com/datasheets/443971.pdf?src-supplier=Element14; ComponentLink4URL: http://www.yageo.com/documents/recent/PYu-RC_Group_51_RoHS_L_10.pdf?src-supplier=Digi-Key; ComponentLink4Description: http://www.yageo.com/documents/recent/PYu-RC_Group_51_RoHS_L_10.pdf?src-supplier=Digi-Key; Supplier Part Number 1: 311-680HRCT-ND
R16 = RC0402FR-072K2L: RES SMD 2.2K OHM 1% 1/16W 0402; Manufacturer: Yageo; Temperature Coefficient: 100ppm/°C; Resistance: 2.2kR; Power Rating: 63mW; Voltage Rating: 50V; Supplier 1: Digi-Key; Manufacturer Part Number: RC0402FR-072K2L; Stock 1: 966157; Pricing 1: 1=0.1, 10=0.016, 100=0.0066, 1000=0.00299, 2500=0.00259, 5000=0.00214 (USD); Case/Package: 0402; Min Operating Temperature: -55°C; Max Operating Temperature: 155°C; Tolerance: 1%; Packaging: Tape and Reel; Length: 1mm; Height: 0.35mm; Width: 0.5mm; Depth: 0.5mm; Lead Free: Lead Free; Supplier Part Number 1: 311-2.20KLRCT-ND; Case Code (Imperial): 0402; Case Code (Metric): 1005; Size Code: 0402; Resistor Type: Thick Film; Number of Terminations: 2; Termination: SMD/SMT; Max Power Dissipation: 63mW; Features: Moisture Resistant; Series: RC; Resistance Tolerance: 1%; Construction: Rectangular; Military Standard: Not; RoHS Compliant: Yes; ComponentLink1URL: http://www.farnell.com/datasheets/2167052.pdf?src-supplier=Element14; ComponentLink1Description: http://www.farnell.com/datasheets/2167052.pdf?src-supplier=Element14; LCSC Part Number: C114762; Weight: 2.3E-05oz; Technology: THICK FILM; REACH SVHC: Unknown; ComponentLink2URL: http://www.yageo.com/documents/recent/PYu-RC_Group_51_RoHS_L_9.pdf?src-supplier=Mouser; ComponentLink2Description: http://www.yageo.com/documents/recent/PYu-RC_Group_51_RoHS_L_9.pdf?src-supplier=Mouser; ComponentLink3URL: http://documents.rs-components.com/techlib://itc_doclist_GB.htm?stockno=6186532&src-supplier=RSComponents; ComponentLink3Description: http://documents.rs-components.com/techlib://itc_doclist_GB.htm?stockno=6186532&src-supplier=RSComponents; ComponentLink4URL: http://www.yageo.com/documents/recent/PYu-RC0402_51_RoHS_L_6_r.pdf?src-supplier=Future+Electronics; ComponentLink4Description: http://www.yageo.com/documents/recent/PYu-RC0402_51_RoHS_L_6_r.pdf?src-supplier=Future+Electronics
R31 = RC0402FR-074K7L: RES 4.7K OHM 1% 1/16W 0402; Manufacturer: Yageo; Item Type: Resistor; Voltage Rating (DC): 50V; Power Rating: 62.5mW; Resistance: 4.7kR; Temperature Coefficient: 100ppm/°C; Max Power Dissipation: 63mW; Manufacturer Part Number: RC0402FR-074K7L; ComponentLink1URL: https://datasheet.ciiva.com/22661/1686128-22661342.pdf?src-supplier=Element14; ComponentLink1Description: https://datasheet.ciiva.com/22661/1686128-22661342.pdf?src-supplier=Element14; RoHS: Yes; Category: Chip SMD Resistors; ComponentLink2URL: https://datasheet.ciiva.com/7850/1018594-7850022.pdf?src-supplier=Element14; ComponentLink2Description: https://datasheet.ciiva.com/7850/1018594-7850022.pdf?src-supplier=Element14; ComponentLink3URL: https://datasheet.ciiva.com/7850/1018594-7850023.pdf?src-supplier=Element14; ComponentLink3Description: https://datasheet.ciiva.com/7850/1018594-7850023.pdf?src-supplier=Element14; ComponentLink4URL: https://datasheet.ciiva.com/15215/getdatasheetpartid-328119-15215035.pdf?src-supplier=Verical; ComponentLink4Description: https://datasheet.ciiva.com/15215/getdatasheetpartid-328119-15215035.pdf?src-supplier=Verical; LCSC Part Number: C105871; Supplier 1: Avnet; Stock 1: 2420000; Pricing 1: 10000=0.00085 (USD); Case/Package: 0402; Number of Pins: 2; Case Code (Imperial): 0402; Case Code (Metric): 1005; Size Code: 0402; Min Operating Temperature: -55°C; Max Operating Temperature: 155°C; Tolerance: 1%; Voltage Rating: 50V; Packaging: Tape and Reel; Resistor Type: Thick Film; Termination: SMD/SMT; Features: Moisture Resistant; Series: RC; Number of Terminations: 2; Resistance Tolerance: 1%; Construction: Rectangular; Length: 1mm; Width: 0.5mm; Height: 0.32mm; Depth: 0.5mm; Height - Seated (Max): 0.016inch; RoHS Compliant: Yes; Reach SVHC Compliant: Yes; Military Standard: Not; Lead Free: Lead Free; Supplier Part Number 1: RC0402FR-074K7L
SW3 = TL3300CF160Q: SWITCH TACTILE SPST-NO 0.05A 12V; Manufacturer: E-Switch; Mechanical Life: 200000Cycles; Operating Force: 160gf; Current Rating: 50mA; Throw Configuration: SPST; Contact Resistance: 100mR; Illumination Type: Non-Illuminated; Switch Travel: 0.35mm; Switch Function: Off-Mom; Actuator Type: Standard; Actuator Length: 5mm; Supplier 1: Mouser; Manufacturer Part Number: TL3300CF160Q; Stock 1: 1884; Pricing 1: 1=0.53, 10=0.513, 50=0.43, 100=0.393, 1000=0.293, 10000=0.274 (USD); Mount: Surface Mount; Case/Package: SMD/SMT; Contact Plating: Silver; Min Operating Temperature: -25°C; Max Operating Temperature: 70°C; Package Quantity: 1; Packaging: Tape and Reel; Voltage Rating (DC): 12V; Max Voltage Rating (DC): 12V; Termination: Gull Wing; Electrical Life: 200000Cycles; Orientation: Straight; Series: TL3300; Lead Free: Lead Free; RoHS Compliant: Yes; ComponentLink1URL: http://www.e-switch.com/system/asset/product_line/data_sheet/157/TL3300.pdf?src-supplier=Digi-Key; ComponentLink1Description: http://www.e-switch.com/system/asset/product_line/data_sheet/157/TL3300.pdf?src-supplier=Digi-Key; ComponentLink2URL: http://spec_sheets.e-switch.com/specs/N301102.pdf?src-supplier=Digi-Key; ComponentLink2Description: http://spec_sheets.e-switch.com/specs/N301102.pdf?src-supplier=Digi-Key; Supplier Part Number 1: 612-TL3300CF160Q
SW4 = SS-12D02-G040: Straight 1A SPDT 8.7mm 8.6mm 24V 4.5mm Black PCPin 10000 Rectangular columnar -25℃~+70℃ Plugin Slide Switches ROHS; Manufacturer: G-Switch; Item Type: Switch; Manufacturer Part Number: SS-12D02-G040; Package: Custom; LCSC Part Number: C2876023; ComponentLink1Description: LCSC; ComponentLink1URL: https://www.lcsc.com/product-detail/Slide-Switches_G-Switch-SS-12D02-G040_C2876023.html
U21 = STM32F103ZGT6: IC MCU 32BIT 1MB FLASH 144LQFP; Interface: I2C,SPI,USB,CAN,IrDA,UART,USART,LIN,I2S; Data Bus Width: 32b; Core Architecture: ARM; Number of Timers/Counters: 14; RAM Size: 96KB; Max Power Dissipation: 666mW; Number of I/Os: 112; Oscillator Type: Internal; Clock Frequency: 72MHz; Watchdog Timer: Yes; Peripherals: POR,PWM,WDT,DMA,Temp Sensor,I2C; Number of PWM Channels: 6; Number of ADC Channels: 21; Min Supply Voltage: 2V; Number of SPI Channels: 3; Number of I2C Channels: 2; Max Supply Voltage: 3.6V; Nominal Supply Current: 1.9uA; Number of A/D Converters: 3NUMBER; Number of D/A Converters: 2NUMBER; LCSC Part Number: C44011; Item Type: IC; ComponentLink1Description: LCSC; Supplier: Mouser; Supplier Part Number: 511-STM32F103ZGT6; RoHS: Yes; Category: Microcontrollers; Stock: 8305; Pricing: 1=13.7, 10=12.83, 50=11.16, 100=9.99, 1000=8.77, 10000=8.77 (USD); Case/Package: LQFP; Pins: 144; Min Operating Temperature: -40°C; Max Operating Temperature: 85°C; Packaging: Tray; Series: STM32 F1; Package Quantity: 60; Number of Programmable I/O: 112; Memory Format: FLASH; Memory Size: 1MB; Frequency: 72MHz; Length: 20.2mm; Width: 20.2mm; Height: 1.45mm; Radiation Hardening: No; RoHS Compliant: Yes; Reach SVHC Compliant: No; Lead Free: Lead Free; ComponentLink2URL: https://datasheet.ciiva.com/4841/cd00253742-490410-4841544.pdf?src-supplier=Mouser; ComponentLink2Description: https://datasheet.ciiva.com/4841/cd00253742-490410-4841544.pdf?src-supplier=Mouser; ComponentLink3URL: https://datasheet.ciiva.com/5752/cd00253742-5752891.pdf?src-supplier=Farnell; ComponentLink3Description: https://datasheet.ciiva.com/5752/cd00253742-5752891.pdf?src-supplier=Farnell
X1 = XC32M4-8.000-F18LJDT: 8MHz SMD Crystal Resonator 18pF 200Ω ±20ppm ±30ppm -40℃~+85℃ SMD3225-4P Crystals ROHS; Manufacturer: HCI; Manufacturer Part Number: XC32M4-8.000-F18LJDT; ComponentLink1Description: LCSC; ComponentLink1URL: https://www.lcsc.com/product-detail/Crystals_HCI-XC32M4-8-000-F18LJDT_C2905353.html
X3 = X321532768KGD2SI: 32.768kHz SMD Crystal Resonator 12.5pF ±20ppm -40℃~+85℃ SMD3215-2P Crystals ROHS; Manufacturer: Yangxing Tech; Manufacturer Part Number: X321532768KGD2SI; Footprint: Custom; ComponentLink1Description: LCSC; ComponentLink1URL: https://www.lcsc.com/product-detail/Crystals_Yangxing-Tech-X321532768KGD2SI_C620155.html